# Altium schematic sheet OLED_Section.SchDoc
size A4; DocumentNumber: 8; SheetNumber: 8; SheetTotal: 9
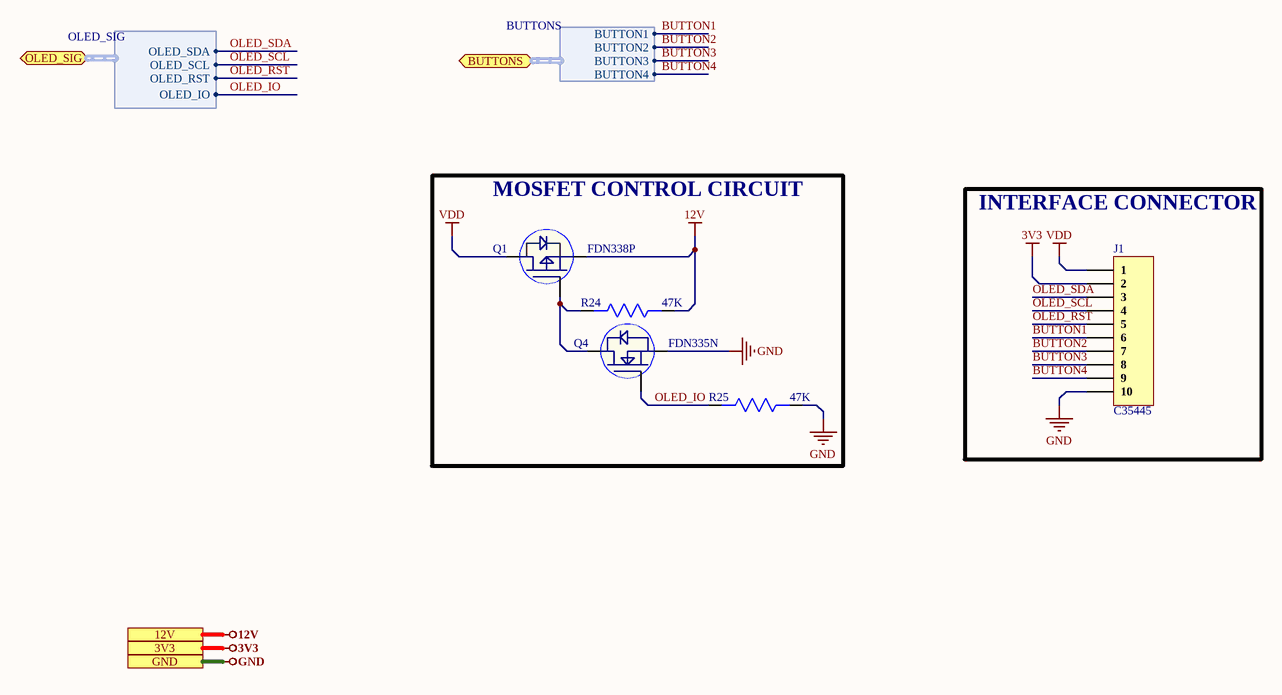
[diagram p0: OLED_Section.SchDoc]

## Parts
J1  C35445  [C35445]
Q1  FDN338P  [SOT23-3]
Q4  FDN335N  [SOT23-3]
R24  47K  [Res0402]
R25  47K  [Res0402]

## Blocks framed on the sheet
MOSFET CONTROL CIRCUIT: Q1 Q4 R24 R25
INTERFACE CONNECTOR: J1

## Ports
3V3, 12V, BUTTONS (bidir, harness BUTTONS), GND, OLED_SIG (bidir, harness OLED_SIG)

## Harnesses
OLED_SIG: OLED_SDA, OLED_SCL, OLED_RST, OLED_IO
BUTTONS: BUTTON1, BUTTON2, BUTTON3, BUTTON4

## Nets
3V3: J1.2 ; port 3V3
12V: Q1.2(S) R24.1 ; port 12V
GND: J1.10 Q4.2(S) R25.1 ; port GND
VDD: J1.1 Q1.3(D)
BUTTON1: J1.6 ; port BUTTONS.BUTTON1
BUTTON2: J1.7 ; port BUTTONS.BUTTON2
BUTTON3: J1.8 ; port BUTTONS.BUTTON3
BUTTON4: J1.9 ; port BUTTONS.BUTTON4
OLED_IO: Q4.1(G) R25.2 ; port OLED_SIG.OLED_IO
OLED_RST: J1.5 ; port OLED_SIG.OLED_RST
OLED_SCL: J1.4 ; port OLED_SIG.OLED_SCL
OLED_SDA: J1.3 ; port OLED_SIG.OLED_SDA
NetQ1_1: Q1.1(G) Q4.3(D) R24.2

## Notes on the sheet
- 1
- Huzaifa Ali

## Library data of the parts
J1 = C35445: 2.54mm Straight 1x10P 10 1 Plugin,P=2.54mm Female Headers ROHS; Manufacturer: BOOMELE; ComponentLink1Description: LCSC; ComponentLink1URL: https://lcsc.com/product-detail/span-style-background-color-ff0-Female-span-Headers_BOOMELE-Boom-Precision-Elec-C35445_C35445.html; Manufacturer Part No: C35445; Package: Custom
Q1 = FDN338P: 20V 1.6A 500mW 115mΩ@4.5V,1.6A 1.5V@250μA P Channel SOT-23 MOSFETs ROHS; Manufacturer: UMW; Manufacturer Part No: FDN338P; Package: SOT-23
Q4 = FDN335N: SOT-23 MOSFETs ROHS; Manufacturer: UMW; Manufacturer Part No: FDN335N; Package: SOT-23; Value: *; ComponentLink1Description: LCSC; ComponentLink1URL: https://lcsc.com/product-detail/MOSFETs_UMW-Youtai-Semiconductor-Co-Ltd-FDN335N_C347512.html
R24 R25 = RC0402FR-0747KL: RES SMD 47K OHM 1% 1/16W 0402; Manufacturer: Yageo; Power Rating: 62.5mW; Temperature Coefficient: 100ppm/°C; Voltage Rating: 50V; Resistance: 47kR; Max Power Dissipation: 63mW; Supplier 1: Digi-Key; Manufacturer Part Number: RC0402FR-0747KL; Stock 1: 0; Pricing 1: 1=0.1, 10=0.016, 100=0.0064, 1000=0.00289, 2500=0.00251, 5000=0.00207 (USD); Case/Package: 0402; Case Code (Imperial): 0402; Case Code (Metric): 1005; Min Operating Temperature: -55°C; Max Operating Temperature: 155°C; Tolerance: 1%; Packaging: Tape and Reel; Package Quantity: 1; Termination: SMD/SMT; Composition: Thick Film; Number of Terminations: 2; Military Standard: Not; Features: Moisture Resistant; Length: 1mm; Height: 0.016inch; Depth: 0.5mm; Width: 0.5mm; REACH SVHC: Unknown; Lead Free: Lead Free; ComponentLink1URL: http://www.yageo.com/documents/recent/PYu-RC0402_51_RoHS_L_6_r.pdf?src-supplier=Future+Electronics; ComponentLink1Description: http://www.yageo.com/documents/recent/PYu-RC0402_51_RoHS_L_6_r.pdf?src-supplier=Future+Electronics; ComponentLink2URL: http://www.farnell.com/datasheets/1018594.pdf?src-supplier=Element14; ComponentLink2Description: http://www.farnell.com/datasheets/1018594.pdf?src-supplier=Element14; ComponentLink3URL: https://www.verical.com/server-webapp/html/getDatasheet?partID=323748&src-supplier=Verical; ComponentLink3Description: https://www.verical.com/server-webapp/html/getDatasheet?partID=323748&src-supplier=Verical; ComponentLink4URL: http://www.yageo.com/documents/recent/PYu-RC_Group_51_RoHS_L_10.pdf?src-supplier=Digi-Key; ComponentLink4Description: http://www.yageo.com/documents/recent/PYu-RC_Group_51_RoHS_L_10.pdf?src-supplier=Digi-Key; Supplier Part Number 1: 311-47.0KLRDKR-ND